# Altium schematic sheet Battery_Management.SchDoc
size A4; SheetNumber: 2; SheetTotal: 5
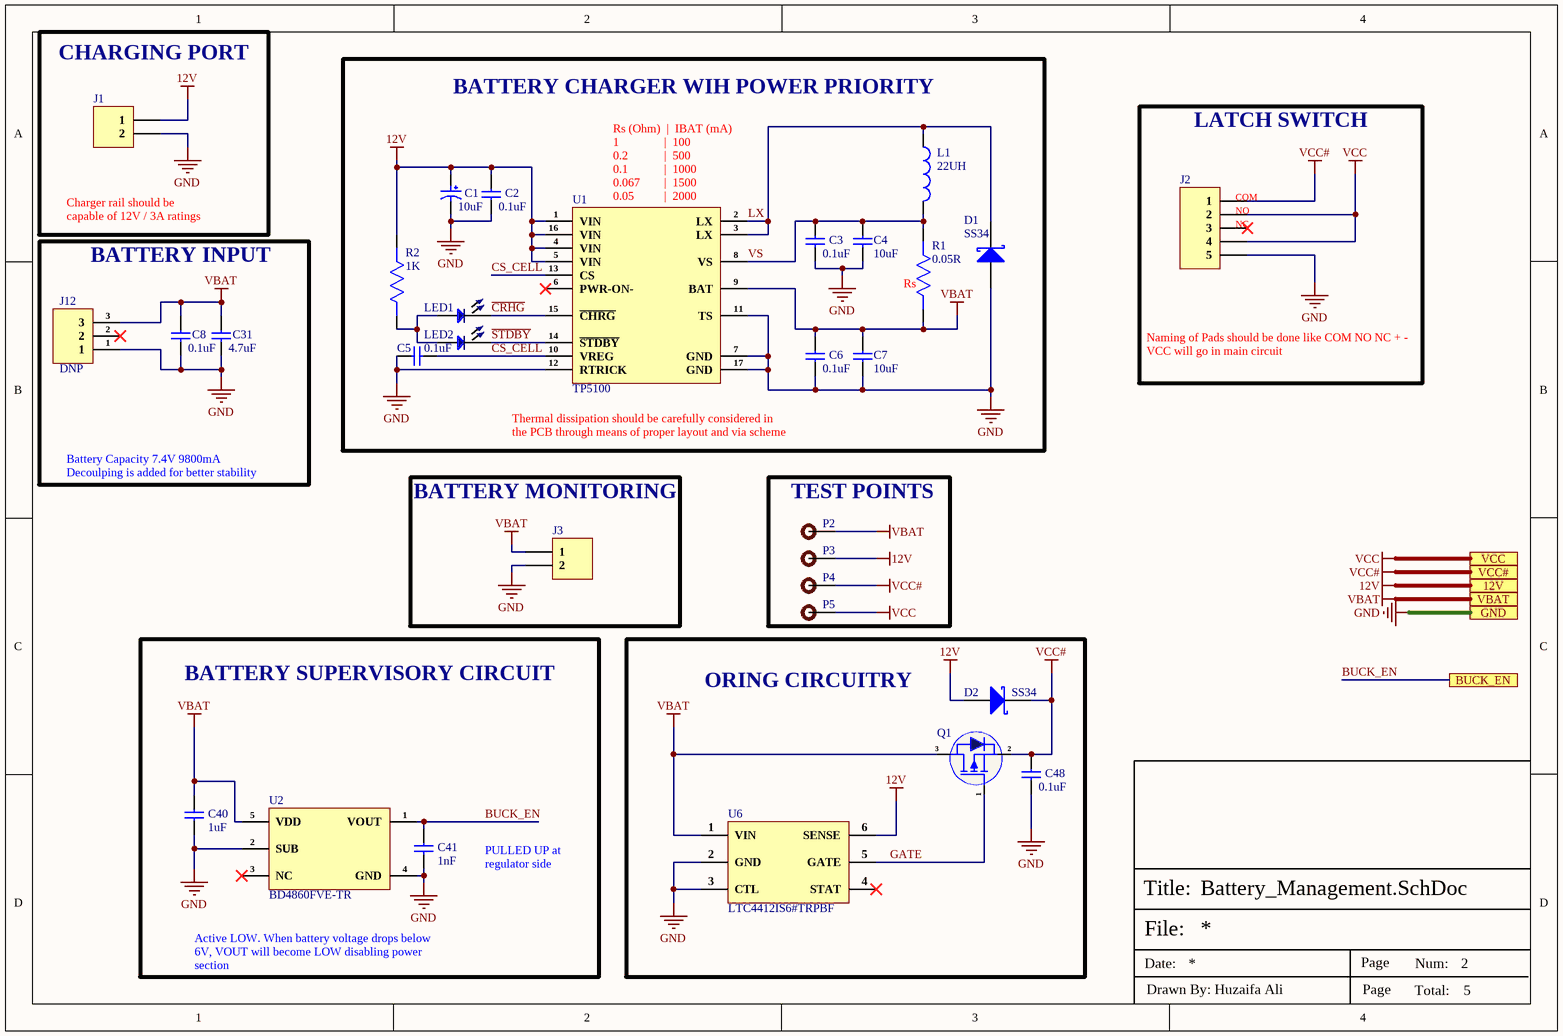
[diagram p0: Battery_Management.SchDoc]

## Parts
C1  10uF  [RVT1E100M0405_]
C2  0.1uF  [Cap-0603]
C3  0.1uF  [Cap-0603]
C4  10uF  [Cap-0603]
C5  0.1uF  [Cap-0603]
C6  0.1uF  [Cap-0603]
C7  10uF  [Cap-0603]
C8  0.1uF  [Cap-0603]
C31  4.7uF  [Cap-0603]
C40  1uF  [Cap-0603]
C41  1nF  [CAP-0603]
C48  0.1uF  [Cap-0603]
D1  SS34  [SMA]
D2  SS34  [SMA]
J1  2P THrough Hole Pads  [2P THrough Hole Pads]  (value not drawn)
J2  5P Through Hole Pads  [5P Through Hole Pads]  (value not drawn)
J3  2P THrough Hole Pads  [2P THrough Hole Pads]  (value not drawn)
J12  DNP  [B3P-VH(LF)(SN)]
L1  22UH  [YPRH1204-220M_]
LED1  Emerald  [LED-0603]  (value not drawn)
LED2  RED  [LED-0603]  (value not drawn)
P2  TEST POINT  [Test-point]  (value not drawn)
P3  TEST POINT  [Test-point]  (value not drawn)
P4  TEST POINT  [Test-point]  (value not drawn)
P5  TEST POINT  [Test-point]  (value not drawn)
Q1  20P03-HXY  [20P03-HXY]  (value not drawn)
R1  0.05R  [RES-2010]
R2  1K  [Res-0603]
U1  TP5100  [TQFN-16-EP(4x4)_]
U2  BD4860FVE-TR  [VSOF-5]
U6  LTC4412IS6#TRPBF  [SOT-23-6]

## Blocks framed on the sheet
CHARGING PORT: J1
BATTERY CHARGER WIH POWER PRIORITY: C1-C7 D1 L1 LED1 LED2 R1 R2 U1
LATCH SWITCH: J2
BATTERY INPUT: C8 C31 J12
BATTERY MONITORING: J3
TEST POINTS: P2-P5
BATTERY SUPERVISORY CIRCUIT: C40 C41 U2
ORING CIRCUITRY: C48 D2 Q1 U6

## Ports
12V, BUCK_EN, GND, VBAT, VCC, VCC#

## Nets
12V: C1.1 C2.2 D2.2(A) J1.1 P3.1 R2.1 U1.1(VIN) U1.4(VIN) U1.5(VIN) U1.16(VIN) U6.6(SENSE) ; port 12V
GND: C1.2 C2.1 C3.1 C4.1 C5.1 C6.1 C7.1 C8.1 C31.1 C40.1 C41.1 C48.1 D1.2(A) J1.2 J2.5 J3.2 J12.1 U1.7(GND) U1.11(TS) U1.12(RTRICK) U1.17(GND) U2.2(SUB) U2.4(GND) U6.2(GND) U6.3(CTL) ; port GND
VBAT: C6.2 C7.2 C8.2 C31.2 C40.2 J3.1 J12.3 P2.1 Q1.3(D) R1.2 U1.9(BAT) U2.5(VDD) U6.1(VIN) ; port VBAT
VCC: J2.2 J2.4 P5.1 ; port VCC
VCC#: C48.2 D2.1(K) J2.1 P4.1 Q1.2(S) ; port VCC#
BUCK_EN: C41.2 U2.1(VOUT) ; port BUCK_EN
~{CRHG}: LED1.2 U1.15(~{CHRG})
CS_CELL: C5.2 U1.10(VREG) U1.13(CS)
GATE: Q1.1(G) U6.5(GATE)
LX: D1.1(K) L1.1 U1.2(LX) U1.3(LX)
~{STDBY}: LED2.2 U1.14(~{STDBY})
VS: C3.2 C4.2 L1.2 R1.1 U1.8(VS)
NetLED1_1: LED1.1 LED2.1 R2.2

Not connected (* = marked no-connect by the designer): J2 3*; J12 2*; U1 6(PWR-ON-)*; U2 3(NC)*; U6 4(STAT)*

## Notes on the sheet
- Charger rail should be capable of 12V / 3A ratings
- (near U1) Rs (Ohm)  |  IBAT (mA)
  1               |  100
  0.2            |  500
  0.1            |  1000
  0.067        |  1500
  0.05          |  2000
- (near J2) +
- (near J2) -
- (near J2) COM
- (near J2) NO
- (near J2) NC
- (near R1) Rs
- Naming of Pads should be done like COM NO NC + -
  VCC will go in main circuit
- Thermal dissipation should be carefully considered in the PCB through means of proper layout and via scheme
- Battery Capacity 7.4V 9800mA
- Decoulping is added for better stability
- PULLED UP at
  regulator side
- Active LOW. When battery voltage drops below 6V, VOUT will become LOW disabling power section
- File:
- Title:
- Date:
- Page
- Num:
- Total:
- Drawn By: Huzaifa Ali

## Library data of the parts
C1 = RVT1E100M0405: CAP ALUM 10uF 25V SMD; Manufacturer: ROQANG; φD: 4mm; L: 5.4mm; Tolerance: ±20%; Item Type: Capacitor; Operating Temperature: -45℃~+105℃; Rated Voltage: 25V; Capacitance: 10uF; Manufacturer Part Number: RVT1E100M0405; ComponentLink1Description: LCSC; ComponentLink1URL: https://www.lcsc.com/product-detail/Aluminum-Electrolytic-Capacitors-SMD_10uF-25V-20_C72484.html; LCSC Part Number: C970655
C2 C3 C5 C6 C8 C48 = CC0603KRX5R9BB104: CAP CER 0.1UF 50V X5R 0603; Manufacturer: Yageo; Capacitance: 100nF; Tolerance: 10%; Item Type: Capacitor; Supplier 1: Digi-Key; Manufacturer Part Number: CC0603KRX5R9BB104; RoHS: Yes; Category: Ceramic Capacitors; Stock 1: 152253; Pricing 1: 1=0.10000, 10=0.05200, 50=0.02820, 100=0.02310, 500=0.01648, 1000=0.01294 (USD); Mount: Surface Mount; Case/Package: 0603; Case Code (Imperial): 0603; Case Code (Metric): 1608; Weight: 7.1E-05oz; Min Operating Temperature: -55°C; Max Operating Temperature: 85°C; Packaging: Tape and Reel; Voltage Rating: 50V; Dielectric: X5R; Termination: SMD/SMT; Voltage Rating (DC): 50V; Package Quantity: 4000; Length: 0.063inch; Width: 0.031inch; Thickness: 0.035inch; Lead Free: Lead Free; Halogen Free: Halogen Free; ComponentLink1URL: http://www.mouser.com/ds/2/447/Yageo_UPY-GP_NP0_16V-to-50V_9-358835.pdf?src-supplier=Mouser; ComponentLink1Description: http://www.mouser.com/ds/2/447/Yageo_UPY-GP_NP0_16V-to-50V_9-358835.pdf?src-supplier=Mouser; ComponentLink2URL: https://www.yageo.com/upload/media/product/productsearch/datasheet/mlcc/UPY-GPHC_X5R_4V-to-50V_26.pdf?src-supplier=Digi-Key; ComponentLink2Description: https://www.yageo.com/upload/media/product/productsearch/datasheet/mlcc/UPY-GPHC_X5R_4V-to-50V_26.pdf?src-supplier=Digi-Key; ComponentLink3URL: http://www.yageo.com/exep/pages/download/literatures/ProductSelectionGuide%202014_Final_2.pdf?src-supplier=Digi-Key; ComponentLink3Description: http://www.yageo.com/exep/pages/download/literatures/ProductSelectionGuide%202014_Final_2.pdf?src-supplier=Digi-Key; Supplier Part Number 1: 311-4046-1-ND; LCSC Part Number: C110022
C4 C7 = CL10A106MA8NRNC: CAP CER 10UF 25V X5R 0603; Manufacturer: Samsung; Tolerance: 20%; Supplier 1: Avnet; Manufacturer Part Number: CL10A106MA8NRNC; RoHS: Yes; Category: Ceramic Capacitors; Pricing 1: 4000=0.03753, 8000=0.03700, 16000=0.03595, 24000=0.03515, 32000=0.03383, 40000=0.03304, 400000=0.03225 (USD); Mount: Surface Mount; Case/Package: 0603; Case Code (Metric): 1608; Case Code (Imperial): 0603; Contact Plating: Tin; Min Operating Temperature: -55°C; Max Operating Temperature: 85°C; Package Quantity: 1; Packaging: Tape and Reel; Capacitance: 10uF; Voltage Rating: 25V; Dielectric: X5R; Termination: Wraparound; Series: CL; Construction: Flat; Length: 0.063inch; Width: 0.031inch; Thickness: 0.035inch; Lead Free: Lead Free; RoHS Compliant: Yes; ComponentLink1URL: https://datasheet.ciiva.com/25766/cl10a106ma8nrnc-25766562.pdf?src-supplier=Digi-Key; ComponentLink1Description: https://datasheet.ciiva.com/25766/cl10a106ma8nrnc-25766562.pdf?src-supplier=Digi-Key; Supplier Part Number 1: CL10A106MA8NRNC; LCSC Part Number: C96446
C31 = C1608X5R1E475KT000E: CAP CER, 4.7 µF, 25 V, 0603; Manufacturer: TDK; Dielectric Material: Ceramic; Tolerance: 10%; Voltage Rating: 25V; Dielectric: X5R; Supplier 1: Digi-Key; Manufacturer Part Number: C1608X5R1E475KT000E; RoHS: No; Supplier Part Number 1: 2220Y1000562GCT-ND; Supplier 2: RSComponents; Category: Ceramic Capacitors; Stock 2: 16120; Pricing 2: 100=0.23400, 200=0.21900, 1000=0.20700, 2000=0.18700 (GBP); Mount: Surface Mount; Case/Package: 0603; Weight: 7.1E-05oz; Case Code (Metric): 1608; Case Code (Imperial): 0603; Min Operating Temperature: -55°C; Max Operating Temperature: 85°C; Termination: SMD/SMT; Resistor Type: Ceramic; Packaging: Tape and Reel; Capacitance: 4.7uF; Package Quantity: 4000; Voltage Rating (DC): 25V; Length: 1.6mm; Width: 0.031inch; Height: 0.8mm; Thickness: 0.039inch; Depth: 0.8mm; Lead Free: Lead Free; REACH SVHC: No SVHC; ComponentLink1URL: https://datasheet.ciiva.com/48587/6print-detail-pdf-phplangenpart-noc1608x5r1e475k080acimp-unit-xmhz-48587141.pdf?src-supplier=Onlinecomponents.com; ComponentLink1Description: https://datasheet.ciiva.com/48587/6print-detail-pdf-phplangenpart-noc1608x5r1e475k080acimp-unit-xmhz-48587141.pdf?src-supplier=Onlinecomponents.com; ComponentLink2URL: https://datasheet.ciiva.com/24216/mlcc-commercial-general-en-24216326.pdf?src-supplier=Mouser; ComponentLink2Description: https://datasheet.ciiva.com/24216/mlcc-commercial-general-en-24216326.pdf?src-supplier=Mouser; ComponentLink3URL: https://datasheet.ciiva.com/48671/mlcc-commercial-general-en-48671304.pdf?src-supplier=Avnet; ComponentLink3Description: https://datasheet.ciiva.com/48671/mlcc-commercial-general-en-48671304.pdf?src-supplier=Avnet; Supplier Part Number 2: 9159158P; LCSC Part Number: C76615
C40 = CC0603KRX5R8BB105: CAP CER 1UF 25V X5R 0603; Manufacturer: Yageo; Tolerance: 10%; Item Type: Capacitor; Supplier 1: Digi-Key; Manufacturer Part Number: CC0603KRX5R8BB105; RoHS: Yes; Category: Ceramic Capacitors; Stock 1: 919939; Pricing 1: 1=0.12000, 10=0.08400, 50=0.04760, 100=0.03940, 500=0.02764, 1000=0.02288 (USD); Mount: Surface Mount; Case/Package: 0603; Number of Pins: 2; Case Code (Metric): 1608; Case Code (Imperial): 0603; Min Operating Temperature: -55°C; Max Operating Temperature: 85°C; Capacitance: 1uF; Dielectric: X5R; Package Quantity: 1; Voltage Rating: 25V; Packaging: Tape and Reel; Termination: SMD/SMT; Voltage Rating (DC): 25V; Series: CC; Construction: Flat; Length: 1.6mm; Width: 0.031inch; Height: 0.8mm; Thickness: 0.035inch; Depth: 0.8mm; Radiation Hardening: No; REACH SVHC: No SVHC; Lead Free: Lead Free; Halogen Free: Halogen Free; RoHS Compliant: Yes; ComponentLink1URL: https://datasheet.ciiva.com/176/mlccorderingcode-176785.pdf?src-supplier=Digi-Key; ComponentLink1Description: https://datasheet.ciiva.com/176/mlccorderingcode-176785.pdf?src-supplier=Digi-Key; ComponentLink2URL: https://datasheet.ciiva.com/176/mlccorderingcode-176786.pdf?src-supplier=Digi-Key; ComponentLink2Description: https://datasheet.ciiva.com/176/mlccorderingcode-176786.pdf?src-supplier=Digi-Key; ComponentLink3URL: https://datasheet.ciiva.com/176/mlccorderingcode-176787.pdf?src-supplier=Digi-Key; ComponentLink3Description: https://datasheet.ciiva.com/176/mlccorderingcode-176787.pdf?src-supplier=Digi-Key; ComponentLink4URL: https://datasheet.ciiva.com/17436/upy-gphc-x5r-4v-to-50v-12-17436952.pdf?src-supplier=Avnet+Europe; ComponentLink4Description: https://datasheet.ciiva.com/17436/upy-gphc-x5r-4v-to-50v-12-17436952.pdf?src-supplier=Avnet+Europe; ComponentLink5URL: https://datasheet.ciiva.com/7978/1525783-7978171.pdf?src-supplier=Element14; ComponentLink5Description: https://datasheet.ciiva.com/7978/1525783-7978171.pdf?src-supplier=Element14; ComponentLink6URL: https://datasheet.ciiva.com/11586/upy-gphc-x5r-4v-to-50v-12-11586318.pdf?src-supplier=Avnet; ComponentLink6Description: https://datasheet.ciiva.com/11586/upy-gphc-x5r-4v-to-50v-12-11586318.pdf?src-supplier=Avnet; Supplier Part Number 1: 311-1445-1-ND; LCSC Part Number: C14664
C41 = CC0603JRNPO8BN102: CAP CER 1000PF 25V C0G/NPO 0603; Manufacturer: Yageo; Tolerance: 5%; Dielectric: C0G; Supplier 1: Digi-Key; Manufacturer Part Number: CC0603JRNPO8BN102; Stock 1: 290818; Pricing 1: 1=0.1, 10=0.072, 50=0.0394, 100=0.0322, 500=0.02298, 1000=0.01806 (USD); Mount: Surface Mount; Case/Package: 0603; Case Code (Metric): 1608; Case Code (Imperial): 0603; Min Operating Temperature: -55°C; Max Operating Temperature: 125°C; Capacitance: 1nF; Voltage Rating: 25V; Packaging: Tape and Reel; Package Quantity: 1; Termination: SMD/SMT; Voltage Rating (DC): 25V; Series: CC; Construction: Flat; Length: 1.6mm; Width: 0.031inch; Height: 0.8mm; Thickness: 0.035inch; Depth: 0.8mm; Radiation Hardening: No; REACH SVHC: Unknown; Lead Free: Lead Free; RoHS Compliant: Yes; ComponentLink1URL: http://www.farnell.com/datasheets/1132289.pdf?src-supplier=Element14; ComponentLink1Description: http://www.farnell.com/datasheets/1132289.pdf?src-supplier=Element14; ComponentLink2URL: http://www.farnell.com/datasheets/2213336.pdf?src-supplier=Element14; ComponentLink2Description: http://www.farnell.com/datasheets/2213336.pdf?src-supplier=Element14; ComponentLink3URL: http://www.yageo.com/documents/recent/UPY-GP_NP0_16V-to-50V_16.pdf?src-supplier=Digi-Key; ComponentLink3Description: http://www.yageo.com/documents/recent/UPY-GP_NP0_16V-to-50V_16.pdf?src-supplier=Digi-Key; ComponentLink4URL: http://www.yageo.com/exep/pages/download/literatures/ProductSelectionGuide%202014_Final_2.pdf?src-supplier=Digi-Key; ComponentLink4Description: http://www.yageo.com/exep/pages/download/literatures/ProductSelectionGuide%202014_Final_2.pdf?src-supplier=Digi-Key; ComponentLink5URL: http://www.yageo.com/documents/recent/UPY-GP_NP0_16V-to-50V_8.pdf?src-supplier=Avnet; ComponentLink5Description: http://www.yageo.com/documents/recent/UPY-GP_NP0_16V-to-50V_8.pdf?src-supplier=Avnet; ComponentLink6URL: https://www.verical.com/server-webapp/html/getDatasheet?partID=403523&src-supplier=Verical; ComponentLink6Description: https://www.verical.com/server-webapp/html/getDatasheet?partID=403523&src-supplier=Verical; ComponentLink7URL: http://www.yageo.com/documents/recent/UPY-GP_NP0_16V-to-50V_8.pdf?src-supplier=Avnet+Europe; ComponentLink7Description: http://www.yageo.com/documents/recent/UPY-GP_NP0_16V-to-50V_8.pdf?src-supplier=Avnet+Europe; Supplier Part Number 1: 311-1342-1-ND; LCSC Part Number: C309470
D1 D2 = SS34: 0.5mA@40V 40V Single 3A 0.55V@3A SMA(DO-214AC) Schottky Barrier Diodes (SBD) ROHS; Manufacturer: MDD; Item Type: Diode; Manufacturer Part Number: SS34; Package: SMA(DO-214AC); LCSC Part Number: C8678; ComponentLink1Description: LCSC; ComponentLink1URL: https://www.lcsc.com/product-detail/Schottky-Barrier-Diodes-SBD_MDD-Microdiode-Electronics-SS34_C8678.html
J1 J3 = 2P THrough Hole Pads: Wire Connecting Pad; Manufacturer Part Number: 2P THrough Hole Pads; Item Type: THrough Hole Pads
J2 = 5P Through Hole Pads: Wire Connecting Pads; Manufacturer Part Number: 5P Through Hole Pads; Item Type: Through Hole Pads
J12 = B3P-VH(LF)(SN): 1x3P VH 1 3.96mm 3 Brass Plugin,P=3.96mm Wire To Board / Wire To Wire Connector ROHS; Manufacture: JST Sales America; ComponentLink1Description: LCSC; ComponentLink1URL: https://www.lcsc.com/product-detail/Wire-To-Board-Wire-To-Wire-Connector_JST-Sales-America-B3P-VH-LF-SN_C160316.html; Manufacture part number: B3P-VH(LF)(SN); Pakage: Plugin,P=3.96mm; LCSC part number: C160316; Item type: Connector
L1 = YPRH1204-220M: 2.9A 22uH ±20% 66mΩ SMD,12x12x5mm Power Inductors ROHS; Manufacturer: YJYCOIN; Manufacturer Part Number: YPRH1204-220M; Package: SMD,12x12x5mm; LCSC Part Number: C338845; Item Type: Inductor; ComponentLink1Description: LCSC; ComponentLink1URL: https://www.lcsc.com/product-detail/Power-Inductors_YJYCOIN-YPRH1204-220M_C338845.html
LED1 = NCD0603G2: Emerald 0603 Light Emitting Diodes (LED) ROHS; Manufacturer: Foshan NationStar Optoelectronics; Manufacturer Part Number: NCD0603G2; Package: 0603; LCSC Part Number: C87326; Item Type: LED; ComponentLink1Description: LCSC; ComponentLink1URL: https://www.lcsc.com/product-detail/Light-Emitting-Diodes-LED_Foshan-NationStar-Optoelectronics-NCD0603G2_C87326.html
LED2 = NCD0603R3: 0603 Light Emitting Diodes (LED) ROHS; Manufacturer: Foshan NationStar Optoelectronics; Manufacturer Part Number: NCD0603R3; Package: 0603; Item Type: LED; LCSC Part Number: C3151730; ComponentLink1Description: LCSC; ComponentLink1URL: https://www.lcsc.com/product-detail/Light-Emitting-Diodes-LED_Foshan-NationStar-Optoelectronics-NCD0603R3_C3151730.html
P2-P5 = TEST POINT: Test Point ON
Q1 = 20P03-HXY: 30V 20A 29W 39mΩ@10V,15A 2.5V@250uA P Channel 1345pF@15V TO-252-2L MOSFETs ROHS; Manufacturer: HXY MOSFET; Item Type: Mosfet; Manufacturer Part Number: 20P03-HXY; Package: TO-252-2L; LCSC Part Number: C4748750; ComponentLink1Description: LCSC; ComponentLink1URL: https://www.lcsc.com/product-detail/MOSFETs_HXY-MOSFET-20P03-HXY_C4748750.html
R1 = WSL2010R0500FEA: RES 0.05 OHM 1% 1/2W 2010; Manufacturer: Vishay Dale; Temperature Coefficient: 75ppm/°C; Resistance: 50mR; Power Rating: 500mW; Voltage Rating: 150mV; Item Type: Resistor; Supplier 1: Digi-Key; Manufacturer Part Number: WSL2010R0500FEA; RoHS: No; Category: Chip SMD Resistors; Stock 1: 20000; Pricing 1: 1=0.92000, 10=0.81400, 25=0.74800, 50=0.68240, 100=0.59060, 250=0.49876, 500=0.42000, 1000=0.35000 (USD); Mount: Surface Mount; Case/Package: 2010; Number of Pins: 2; Contact Plating: Tin,Matte; Weight: 0.001372oz; Case Code (Metric): 5025; Case Code (Imperial): 2010; Min Operating Temperature: -65°C; Max Operating Temperature: 170°C; Resistor Type: Metal Element,Metal Strip; Tolerance: 1%; Features: Moisture Resistant; Number of Terminations: 2; Termination: SMD/SMT; Max Power Dissipation: 500mW; Package Quantity: 1; Packaging: Tape and Reel; Length: 5.08mm; Width: 0.1inch; Height: 0.635mm; Depth: 2.54mm; Radiation Hardening: No; REACH SVHC: No SVHC; Military Standard: Not; Lead Free: Lead Free; ComponentLink1URL: https://datasheet.ciiva.com/2483/wsl-2483729.pdf?src-supplier=Digi-Key; ComponentLink1Description: https://datasheet.ciiva.com/2483/wsl-2483729.pdf?src-supplier=Digi-Key; ComponentLink2URL: https://datasheet.ciiva.com/2483/wsl-2483730.pdf?src-supplier=Digi-Key; ComponentLink2Description: https://datasheet.ciiva.com/2483/wsl-2483730.pdf?src-supplier=Digi-Key; ComponentLink3URL: https://datasheet.ciiva.com/2483/wsl-2483731.pdf?src-supplier=Digi-Key; ComponentLink3Description: https://datasheet.ciiva.com/2483/wsl-2483731.pdf?src-supplier=Digi-Key; ComponentLink4URL: https://datasheet.ciiva.com/7695/wsl-7695158.pdf?src-supplier=Element14; ComponentLink4Description: https://datasheet.ciiva.com/7695/wsl-7695158.pdf?src-supplier=Element14; ComponentLink5URL: https://datasheet.ciiva.com/16215/wsl-16215947.pdf?src-supplier=Future+Electronics; ComponentLink5Description: https://datasheet.ciiva.com/16215/wsl-16215947.pdf?src-supplier=Future+Electronics; ComponentLink6URL: https://datasheet.ciiva.com/17177/wsl-17177243.pdf?src-supplier=Avnet+Europe; ComponentLink6Description: https://datasheet.ciiva.com/17177/wsl-17177243.pdf?src-supplier=Avnet+Europe; ComponentLink7URL: https://datasheet.ciiva.com/28621/1911169-28621837.pdf?src-supplier=Element14; ComponentLink7Description: https://datasheet.ciiva.com/28621/1911169-28621837.pdf?src-supplier=Element14; ComponentLink8URL: https://datasheet.ciiva.com/36857/442550-36857725.pdf?src-supplier=Element14; ComponentLink8Description: https://datasheet.ciiva.com/36857/442550-36857725.pdf?src-supplier=Element14; Supplier Part Number 1: WSLE-.05CT-ND; LCSC Part Number: C844689
R2 = RT0603DRD071KL: RES SMD 1K OHM 0.5% 1/10W 0603; Manufacturer: Yageo; Resistance: 1kR; Temperature Coefficient: 25ppm/°C; Power Rating: 100mW; Voltage Rating: 75V; Voltage Rating (DC): 50V; Supplier 1: Digi-Key; Manufacturer Part Number: RT0603DRD071KL; Stock 1: 178947; Pricing 1: 1=0.2, 10=0.167, 100=0.0651, 1000=0.02725, 2500=0.02498 (USD); Case/Package: 0603; Contact Plating: Tin,Matte; Case Code (Metric): 1608; Case Code (Imperial): 0603; Min Operating Temperature: -55°C; Max Operating Temperature: 125°C; Tolerance: 0.5%; Composition: Thin Film; Packaging: Tape and Reel; Termination: SMD/SMT; Radiation Hardening: No; Lead Free: Lead Free; ComponentLink1URL: http://www.mouser.com/ds/2/447/yageodocoutput-1125656.pdf?src-supplier=Mouser; ComponentLink1Description: http://www.mouser.com/ds/2/447/yageodocoutput-1125656.pdf?src-supplier=Mouser; ComponentLink2URL: http://www.yageo.com/documents/recent/PYu-RT_1-to-0.05_RoHS_L_6.pdf?src-supplier=Avnet; ComponentLink2Description: http://www.yageo.com/documents/recent/PYu-RT_1-to-0.05_RoHS_L_6.pdf?src-supplier=Avnet; Supplier Part Number 1: 311-1.0KDDKR-ND; LCSC Part Number: C165964
U1 = TP5100: TQFN-16-EP(4x4) Battery Management ICs ROHS; Manufacturer: TOPPOWER(Nanjing Extension Microelectronics); Item Type: IC; Manufacturer Part Number: TP5100; Package: TQFN-16-EP(4x4); LCSC Part Number: C379389; ComponentLink1Description: LCSC; ComponentLink1URL: https://www.lcsc.com/product-detail/Battery-Management-ICs_TOPPOWER-Nanjing-Extension-Microelectronics-TP5100_C379389.html
U2 = BD4860FVE-TR: IC SUPERVISOR 1 CHANNEL 5VSOF; Manufacturer: Rohm; Max Supply Voltage: 10V; Max Power Dissipation: 210mW; Min Supply Voltage: 1.2V; Number of Voltages Monitored: 1; Reset: Active Low; Threshold Voltage: 6V; Accuracy: 1%; Operating Supply Current: 900nA; Max Supply Current: 1.98uA; Watchdog Timer: No; Min Reset Threshold Voltage: 5.91V; Max Reset Threshold Voltage: 6.09V; Supplier 1: Digi-Key; Manufacturer Part Number: BD4860FVE-TR; RoHS: Yes; Category: Voltage Supervisors; Stock 1: 5990; Pricing 1: 1=0.64000, 10=0.54900, 25=0.51200, 100=0.40960, 250=0.38032, 500=0.32182, 1000=0.24868 (USD); Mounting Technology: Surface Mount; Case/Package: VSOF; Pins: 5; Min Operating Temperature: -40°C; Max Operating Temperature: 105°C; Package Quantity: 3000; Packaging: Tape and Reel; Number of Monitored Inputs: 1; Type: Simple Reset/Power-On Reset,Voltage Detector; Series: BD48xxx; Lead Free: Lead Free; RoHS Compliant: Yes; ComponentLink1URL: https://datasheet.ciiva.com/1974/bd48xxg-e-1974994.pdf?src-supplier=Digi-Key; ComponentLink1Description: https://datasheet.ciiva.com/1974/bd48xxg-e-1974994.pdf?src-supplier=Digi-Key; ComponentLink2URL: https://datasheet.ciiva.com/8133/bd48xxg-e-8133113.pdf?src-supplier=Avnet; ComponentLink2Description: https://datasheet.ciiva.com/8133/bd48xxg-e-8133113.pdf?src-supplier=Avnet; Supplier Part Number 1: BD4860FVE-CT-ND; LCSC Part Number: C509824; Item Type: IC
U6 = LTC4412IS6#TRPBF: IC OR CTRLR SRC SELECT TSOT23-6; Manufacturer: Analog Devices / Linear Technology; Turn-On Delay Time: 110us; Turn-Off Delay Time: 13us; Operating Supply Current: 15uA; Supplier 1: Digi-Key; Manufacturer Part Number: LTC4412IS6#TRPBF; RoHS: Yes; Category: Uncategorized; Stock 1: 2608; Pricing 1: 1=3.90000, 10=3.50700, 25=3.31520, 100=2.87310, 250=2.72580, 500=2.44584, 1000=2.08500 (USD); Case/Package: SOT-23-6; Number of Pins: 6; Min Operating Temperature: -40°C; Max Operating Temperature: 85°C; Package Quantity: 2500; Packaging: Tape and Reel; Series: PowerPath™; Length: 2.9mm; RoHS Compliant: Yes; ComponentLink1URL: https://datasheet.ciiva.com/1960/1527-1960891.pdf?src-supplier=Digi-Key; ComponentLink1Description: https://datasheet.ciiva.com/1960/1527-1960891.pdf?src-supplier=Digi-Key; Supplier Part Number 1: LTC4412IS6#TRPBFCT-ND; LCSC Part Number: C521306; Item Type: IC